# Altium schematic sheet InPut.SchDoc
size 209 x 297 mm; Letter1Column: A3; Letter2Column: /; Letter3Column: .; DocumentType: Схема електрична принципова
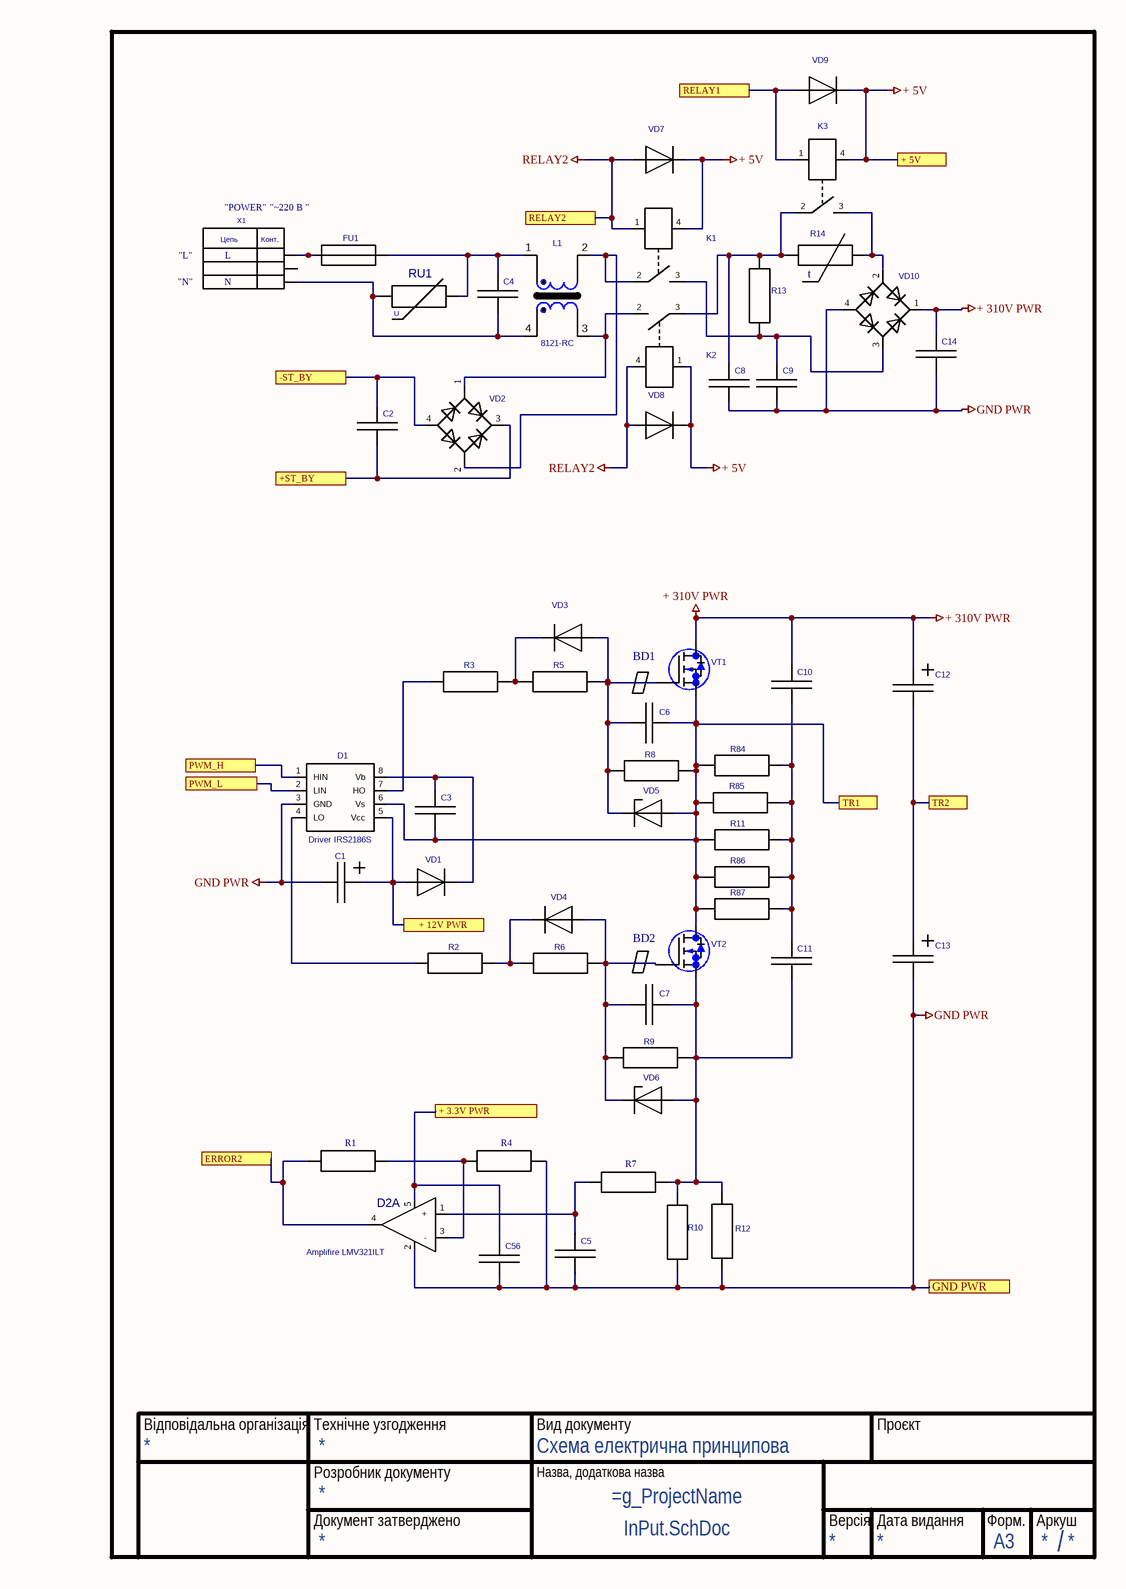
[diagram p0: InPut.SchDoc]

## Parts
C1  Aluminum Electrolytic Capacitors - 10X12  [CAP-D10C5H20]  (value not drawn)
C2  GA355DR7GF472KW01  [CAP-2220 (5_7x5_0mm)]  (value not drawn)
C3  Ceramic Capacitor - 1808  [CAP-0805]  (value not drawn)
C4  GA355DR7GF472KW01  [CAP-2220 (5_7x5_0mm)]  (value not drawn)
C5  Ceramic Capacitor -  0805  [CAP-0805]  (value not drawn)
C6  Ceramic Capacitor  0805  [CAP-0805]  (value not drawn)
C7  Ceramic Capacitor  0805  [CAP-0805]  (value not drawn)
C8  GA355DR7GF472KW01  [CAP-2220 (5_7x5_0mm)]  (value not drawn)
C9  GA355DR7GF472KW01  [CAP-2220 (5_7x5_0mm)]  (value not drawn)
C10  Ceramic Capacitor - 1808  [CAP-1808(4_5x2_0mm)]  (value not drawn)
C11  Ceramic Capacitor - 1808  [CAP-1808(4_5x2_0mm)]  (value not drawn)
C12  Capacitors - EKXG401ELL121MMP1S  [CAP_D18X35.5_VER]  (value not drawn)
C13  Capacitors - EKXG401ELL121MMP1S  [CAP_D18X35.5_VER]  (value not drawn)
C14  GA355DR7GF472KW01  [CAP-2220 (5_7x5_0mm)]  (value not drawn)
C56  Ceramic Capacitor -  0805  [CAP-0805]  (value not drawn)
D1  Driver IRS2186S  [8-SOIC]
D2  Amplifire LMV321ILT  [SOT-23-5]  (part A of 4)
FU1  FUSE_VER  [FUSE-10x38]  (value not drawn)
K1  Purpose Relay  - ALE15B05  [Relay_ALE12]  (value not drawn)
K2  Purpose Relay  - ALE15B05  [Relay_ALE12]  (value not drawn)
K3  Purpose Relay  - ALE15B05  [Relay_ALE12]  (value not drawn)
L1  8121-RC  [FILTER_PWR]
R1  Resistor 0805  [RES-0805]  (value not drawn)
R2  Resistor 1206  [RES-1206]  (value not drawn)
R3  Resistor 1206  [RES-1206]  (value not drawn)
R4  Resistor 0805  [RES-0805]  (value not drawn)
R5  Resistor 1206  [RES-1206]  (value not drawn)
R6  Resistor 1206  [RES-1206]  (value not drawn)
R7  Resistor 0805  [RES-0805]  (value not drawn)
R8  Resistor 1206  [RES-1206]  (value not drawn)
R9  Resistor 1206  [RES-1206]  (value not drawn)
R10  R2512  [RES-2512]  (value not drawn)
R11  Resistor 2512  [RES-2512]  (value not drawn)
R12  R2512  [RES-2512]  (value not drawn)
R13  Resistor 2512  [RES-2512]  (value not drawn)
R14  Inrush Current Limiter - B57237-S  [RES_LIM-15_7_7.5]  (value not drawn)
R84  Resistor 2512  [RES-2512]  (value not drawn)
R85  Resistor 2512  [RES-2512]  (value not drawn)
R86  Resistor 2512  [RES-2512]  (value not drawn)
R87  Resistor 2512  [RES-2512]  (value not drawn)
RU1  Varistor  - CU3225K275G2  [CU3225]  (value not drawn)
VD1  RF Diode 03x02  [CAP-3x2mm]  (value not drawn)
VD2  BRIDGE RECT - DF06S  [DFXXS]  (value not drawn)
VD3  Diode - SOD-123  [DIODE-SMA]  (value not drawn)
VD4  Diode - SOD-123  [DIODE-SMA]  (value not drawn)
VD5  Zener Diode  - SOD-123F  [DIODE-SMA]  (value not drawn)
VD6  Zener Diode  - SOD-123F  [DIODE-SMA]  (value not drawn)
VD7  Diode - S1M  [DIODE-SMA]  (value not drawn)
VD8  Diode - S1M  [DIODE-SMA]  (value not drawn)
VD9  Diode - S1M  [DIODE-SMA]  (value not drawn)
VD10  Bridge Rectifier - GBJ3510  [4GBXXX]  (value not drawn)
VT1  Transistor - C3M0280090  [TO247]  (value not drawn)
VT2  Transistor - C3M0280090D  [TO247]  (value not drawn)
X1  2EDGRC-7.5-03P-14-00A(H)  [DG300-7.5-03P]  (value not drawn)

## Ports
+ 3.3V PWR, + 5V, + 12V PWR, +ST_BY, -ST_BY, ERROR2, GND PWR, PWM_H, PWM_L, RELAY1, RELAY2, TR1, TR2

## Nets
+ 5V: K1.4 K2.1 K3.4 VD7.2 VD8.2 VD9.2 ; port + 5V
+ 310V PWR: C10.2 C12.1(Plus) C14.2 VD10.1(+) VT1.2(D)
GND PWR: C1.2(Minus) C5.1 C8.1 C9.1 C13.2(Minus) C14.1 C56.1 D1.3(GND) D2.2 R4.1 R10.2 R12.2 VD10.4(-) ; port GND PWR
RELAY2: K1.1 K2.4 VD7.1 VD8.1 ; port RELAY2
+ 3.3V PWR: C56.2 D2.5 ; port + 3.3V PWR
+ 12V PWR: C1.1(Plus) D1.5(Vcc) VD1.1 ; port + 12V PWR
+ST_BY: C2.1 VD2.3 ; port +ST_BY
-ST_BY: C2.2 VD2.4 ; port -ST_BY
ERROR2: D2.4 R1.2 ; port ERROR2
PWM_H: D1.1(HIN) ; port PWM_H
PWM_L: D1.2(LIN) ; port PWM_L
RELAY1: K3.1 VD9.1 ; port RELAY1
TR1: C3.1 C6.1 D1.6(Vs) R8.1 R11.2 R84.2 R85.2 R86.2 R87.2 VD5.1 VT1.3(S) VT2.2(D) ; port TR1
TR2: C12.2(Minus) C13.1(Plus) ; port TR2
NetC3_2: C3.2 D1.8(Vb) VD1.2
NetC4_1: C4.1 L1.4 RU1.1 X1.3
NetC4_2: C4.2 FU1.2 L1.1 RU1.2
NetC5_2: C5.2 D2.1(+) R7.2
NetC6_2: C6.2 R5.1 R8.2 VD3.1 VD5.2 VT1.1(G)
NetC7_1: C7.1 C11.1 R7.1 R9.1 R10.1 R12.1 VD6.1 VT2.3(S)
NetC7_2: C7.2 R6.1 R9.2 VD4.1 VD6.2 VT2.1(G)
NetC8_2: C8.2 K2.3 K3.2 R13.1 R14.1
NetC9_2: C9.2 K1.3 R13.2 VD10.3
NetC10_1: C10.1 C11.2 R11.1 R84.1 R85.1 R86.1 R87.1
NetD1_4: D1.4(LO) R2.2
NetD1_7: D1.7(HO) R3.2
NetD2_3: D2.3(-) R1.1 R4.2
NetFU1_1: FU1.1 X1.1
NetK1_2: K1.2 L1.2 VD2.2
NetK2_2: K2.2 L1.3 VD2.1
NetK3_3: K3.3 R14.2 VD10.2
NetR2_1: R2.1 R6.2 VD4.2
NetR3_1: R3.1 R5.2 VD3.2

Not connected (* = marked no-connect by the designer): X1 2

## Notes on the sheet
- "L"
- "POWER"
- (near X1) L
- "~220 В "
- "N"
- (near X1) N
- (near R14) t
- (near VT1) BD1
- (near VT2) BD2
- Відповідальна організація
- Технічне узгодження
- Розробник документу
- Вид документу
- Назва, додаткова назва
- Проєкт
- Документ затверджено
- Версія
- Дата видання
- Форм.
- Аркуш
- (in symbol CU3225) U
- (in symbol DG300-7.5-3P) Цепь; Конт.

## Library data of the parts
C1 = C-RAD-2_5-6_8: Aluminum Electrolytic Capacitors - 25ZLH470MEFC10X12.5470 µF 25 V  Radial, Can 10000 Hrs @ 105°C; Value: 25ZLH470MEFC10X12.5; ComponentLink1Description: on digikey; ComponentLink1URL: https://www.digikey.at/en/products/detail/rubycon/25ZLH470MEFC10X12-5/3563614
C2 C4 C8 C9 C14 = CC0805: Ceramic Capacitor - GA355DR7GF472KW01, 4700 pF ±10% 250VAC, X7R 2220 (5750Metric); Value: GA355DR7GF472KW01; ComponentLink1Description: on digikey; ComponentLink1URL: https://www.digikey.at/en/products/detail/murata-electronics/GA355DR7GF472KW01L/789281
C3 = CC0805: Ceramic Capacitor - GRM21BR71H102KA01, 1000 pF ±10% 250VAC  X7R 1808 (4520 Metric); Value: GRM21BR71H102KA01
C5 C56 = CC0805: Ceramic Capacitor - GRM21BR71H104KA01, 0.1 µF ±10% 50V,  X7R 0805 (2012 Metric); Value: GRM21BR71H104KA01; ComponentLink1Description: on digikey; ComponentLink1URL: https://www.digikey.at/en/products/detail/murata-electronics/GRM21BR71H104KA01L/586718
C6 C7 = CC0805: Ceramic Capacitor - GRM2165C1H101JA01D, 100 pF ±5% 50V, C0G, NP0 0805 (2012 Metric); Value: GRM2165C1H101JA01D; ComponentLink1Description: on digikey; ComponentLink1URL: https://www.digikey.at/en/products/detail/murata-electronics/GRM2165C1H101JA01D/586800?s=N4IgTCBcDaIOICUCyYCMA2ArAYVQCVQAZUApAQWIBEQBdAXyA
C10 C11 = CC0805: Ceramic Capacitor - GRM21BR71H102KA01, 1000 pF ±10% 250VAC, X7R 1808 (4520 Metric); Value: GA342QR7GD102KW01L; ComponentLink1Description: on digikey; ComponentLink1URL: https://www.digikey.at/en/products/detail/murata-electronics/GA342QR7GD102KW01L/789288
C12 C13 = C-RAD-2_5-6_8: 120 µF 400 V Aluminum Electrolytic Capacitors Radial, Can 10000 Hrs @ 105°C; Value: EKXG401ELL121MMP1S; ComponentLink1Description: on digikey; ComponentLink1URL: https://www.digikey.at/en/products/detail/chemi-con/EKXG401ELL121MMP1S/755986
D1 = IRS2186S: Driver FET-IGBT IRS2186S SOP-8, 600V; Iout+: 4 А; Iout-: 4 А /; Value: IRS2186STRPBF; ComponentLink1Description: on digikey; ComponentLink1URL: https://www.digikey.at/en/products/detail/infineon-technologies/IRS2186STRPBF/1300640
D2 = MC34074D: General Purpose Amplifier - LMV321ilt, 1 Circuit,  Rail-to-Rail, SOT23-5; Value: LMV321ILT; ComponentLink1Description: on digikey; ComponentLink1URL: https://www.digikey.at/en/products/detail/stmicroelectronics/LMV321ILT/1003361?s=N4IgTCBcDaIDIFkBqBmMBGAlgGwC4gF0BfIA
FU1 = FUSE_VER: e.fuse.1038.16 E.NEXT. 500V, 16A; Value: gG 63A CH22 ITALWEBER
K1-K3 = Relay_1P: General Purpose Relay - ALE15B05, 16A 277V AC, 200mW, SPST-NO (1 Form A) 5VDC Coil Through Hole; Value: ALE15B05
L1 = PMCE-0160: 8121-RC BOURNS, 20А; Value: 8121-RC
R1 = R0805_IPC: Resistor 0805, 510 Ohm, 5% 0805S8J0153T5E; PartName: Резистор; Note: ROYALOHM; Value: 0805S8J0153T5E
R2 R3 R5 R6 = R2512: Resistor 1206, 5.1 Ohm, 5%RC1206JR-5R1-Hitano
  R2: Value: RC1206JR-5R1- Hitano
  R3 R5 R6: Value: RC1206JR-5R1-Hitano
R4 R7 = R0805_IPC: Resistor 0805, 510 Ohm, 5% 0805S8J0151T5E; PartName: Резистор; Note: ROYALOHM; Value: 0805S8J0151T5E
R8 R9 = R2512: Resistor 1206, 10 kOhm, 5%RC1206JR-10KR-Hitano; Value: RC1206JR-10KR-Hitano
R10 R12 = R2512: RL2512FK-070R01L  Yageo / 0.01 om, 1 w, ± 1% / 1500 ppm/K; Value: RL2512FK-070R01L
R11 R84-R87 = R2512: Resistor 2512, 270 Ohm, 5%RMCF2512JT270R; Value: RMCF2512JT270R
R13 = R2512: Resistor 2512, 1MOhm, 5%, / RC2512JK -1M0-Hitano; Value: RC2512JK -1M0
R14 = R2512: Inrush Current Limiter - B57237-S, 1 Ohms ±20% 9 A 0.591" (15.00mm, 7.5mm); Value: B57237-S; ComponentLink1Description: on digikey; ComponentLink1URL: https://www.digikey.at/en/products/detail/epcos-tdk-electronics/B57237S0109M000/739854
RU1 = CU3225: Varistor  - CU3225K275G2 - 430 V 400 A 1 Circuit Surface Mount, MLCV 3225 (8063 Metric); Value: CU3225K275G2; ComponentLink1Description: on digikey; ComponentLink1URL: https://www.digikey.at/en/products/detail/epcos-tdk-electronics/B72650M0271K072/1006567
VD1 = 1N400X_VER: RF Diode PIN - Single 400V 11.5 W; Value: MA4P7104F-1072T; ComponentLink1Description: on digikey; ComponentLink1URL: https://www.digikey.at/en/products/detail/macom-technology-solutions/MA4P7104F-1072T/4429653
VD2 = DFXXS: DF06S -  BRIDGE RECT 1P 600V 1.5A 4SDIP; Value: DF06S; ComponentLink1Description: on digikey; ComponentLink1URL: https://www.digikey.at/en/products/detail/onsemi/DF06S/974208
VD3 VD4 = 1N400X_VER: Diode 40 V 1A Surface Mount SOD-123; Value: 1N5819HW-7-F
VD5 VD6 = ZENER_SOD232: Zener Diode 20 V 500 mW ±5% Surface Mount SOD-123F; Value: MMSZ5250B; ComponentLink1Description: on digikey; ComponentLink1URL: https://www.digikey.at/en/products/detail/diotec-semiconductor/MMSZ5250B/22190821
VD7-VD9 = VD7_5: Diode - S1M, 1000 V 1A Surface Mount DO-214AC (SMA); Value: S1M
VD10 = 4GBXXX: Bridge Rectifier - GBJ3510, Single Phase Standard 1 kV Through Hole GBJ; Value: GBJ3510; ComponentLink1Description: on digikey; ComponentLink1URL: https://www.digikey.at/en/products/detail/smc-diode-solutions/GBJ3510/7244896
VT1 VT2 = IRG4PH30: Transistor - C3M0280090, N-Channel 900 V 11.5A (Tc) 54W (Tc) Through Hole TO-247-3; ComponentLink1Description: on digikey; ComponentLink1URL: https://www.digikey.at/en/products/detail/wolfspeed-inc/C3M0280090D/5764683
  VT1: Value: C3M0280090
  VT2: Value: C3M0280090D
X1 = DG300-7.5-3P: 2EDGRC-7.5-03P-14-00A(H), Клема вилка винтова кутова,7,5 мм,кількість контактів 3: 15А 300В зелена,на плату; Value: 2EDGRC-7.5-03P-14-00A(H); ComponentLink1Description: on kosmodrom; ComponentLink1URL: http://www.kosmodrom.com.ua/el.php?name=2EDGRC-7.5-03P-14-00AH